# Altium schematic sheet DSP-1.SchDoc
size A4
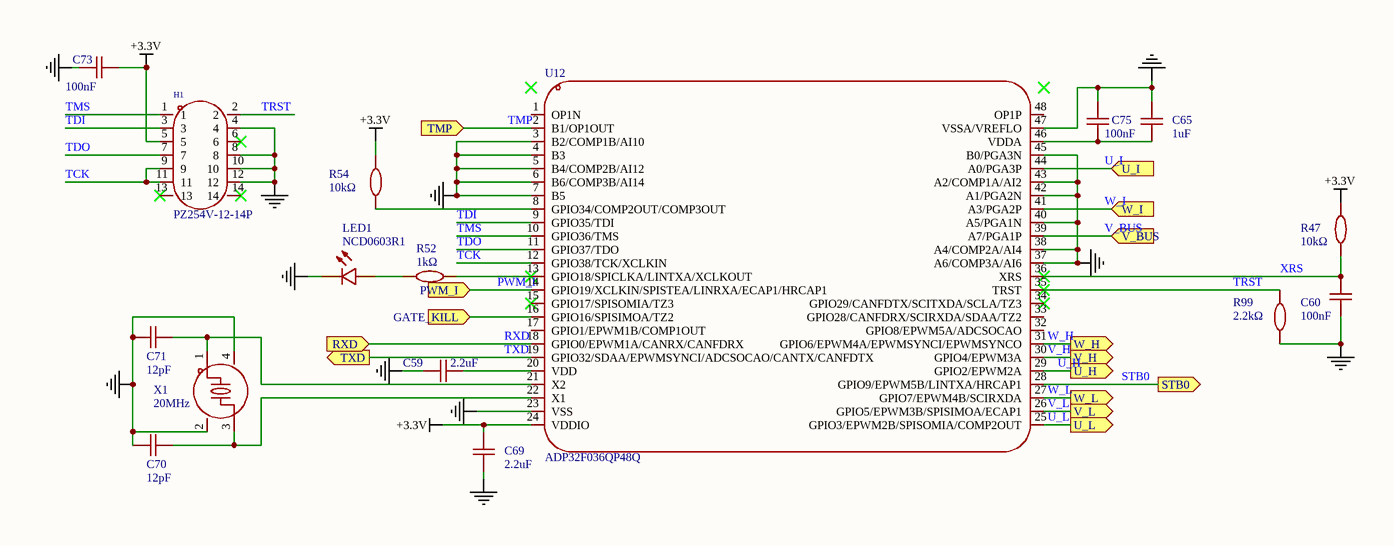
[diagram p0: DSP-1.SchDoc]

## Parts
C59  2.2uF  [C0603]
C60  100nF  [C0603]
C65  1uF  [C0603]
C69  2.2uF  [C0603]
C70  12pF  [C0603]
C71  12pF  [C0603]
C73  100nF  [C0603]
C75  100nF  [C0603]
H1  PZ254V-12-14P  [HDR-TH_14P-P2.54-V-M-R2-C7-S2.54]
LED1  NCD0603R1  [LED0603-RD_RED]
R47  10kΩ  [R0603]
R52  1kΩ  [R0603]
R54  10kΩ  [R0603]
R99  2.2kΩ  [R0603]
U12  ADP32F036QP48Q  [LQFP-48_L7.0-W7.0-P0.50-LS9.0-BL_1]
X1  20MHz  [CRYSTAL-SMD_4P-L3.2-W2.5-BL]

## Ports
GATE_KILL (in), PWM_I (in), RXD (in), STB0 (out), TMP (in), TXD (out), U_H (out), U_I (in), U_L (out), V_BUS (in), V_H (out), V_L (out), W_H (out), W_I (in), W_L (out)

## Nets
+3.3V: C69.1 C73.1 H1.5 R47.2 R54.2 U12.24(VDDIO)
GND: C59.1 C60.1 C65.1 C69.2 C70.2 C71.2 C73.2 C75.1 H1.4 H1.8 H1.10 H1.12 LED1.1(K) R99.1 U12.3(B2/COMP1B/AI10) U12.4(B3) U12.5(B4/COMP2B/AI12) U12.6(B6/COMP3B/AI14) U12.7(B5) U12.23(VSS) U12.37(A6/COMP3A/AI6) U12.38(A4/COMP2A/AI4) U12.40(A5/PGA1N) U12.42(A1/PGA2N) U12.43(A2/COMP1A/AI2) U12.45(B0/PGA3N) U12.47(VSSA/VREFLO) X1.2(GND) X1.4(GND)
GATE_KILL: U12.16(GPIO16/SPISIMOA/TZ2) ; port GATE_KILL
PWM_I: U12.14(GPIO19/XCLKIN/SPISTEA/LINRXA/ECAP1/HRCAP1) ; port PWM_I
RXD: U12.18(GPIO0/EPWM1A/CANRX/CANFDRX) ; port RXD
STB0: U12.28(GPIO9/EPWM5B/LINTXA/HRCAP1) ; port STB0
TCK: H1.9 H1.11 U12.12(GPIO38/TCK/XCLKIN)
TDI: H1.3 U12.9(GPIO35/TDI)
TDO: H1.7 U12.11(GPIO37/TDO)
TMP: U12.2(B1/OP1OUT) ; port TMP
TMS: H1.1 U12.10(GPIO36/TMS)
TRST: H1.2 R99.2 U12.35(TRST)
TXD: U12.19(GPIO32/SDAA/EPWMSYNCI/ADCSOCAO/CANTX/CANFDTX) ; port TXD
U_H: U12.29(GPIO2/EPWM2A) ; port U_H
U_I: U12.44(A0/PGA3P) ; port U_I
U_L: U12.25(GPIO3/EPWM2B/SPISOMIA/COMP2OUT) ; port U_L
V_BUS: U12.39(A7/PGA1P) ; port V_BUS
V_H: U12.30(GPIO4/EPWM3A) ; port V_H
V_L: U12.26(GPIO5/EPWM3B/SPISIMOA/ECAP1) ; port V_L
W_H: U12.31(GPIO6/EPWM4A/EPWMSYNCI/EPWMSYNCO) ; port W_H
W_I: U12.41(A3/PGA2P) ; port W_I
W_L: U12.27(GPIO7/EPWM4B/SCIRXDA) ; port W_L
XRS: C60.2 R47.1 U12.36(XRS)
NetC59_2: C59.2 U12.20(VDD)
NetC65_2: C65.2 C75.2 U12.46(VDDA)
NetC70_1: C70.1 U12.22(X1) X1.3
NetC71_1: C71.1 U12.21(X2) X1.1
NetLED1_2: LED1.2(A) R52.2
NetR52_1: R52.1 U12.13(GPIO18/SPICLKA/LINTXA/XCLKOUT)
NetR54_1: R54.1 U12.8(GPIO34/COMP2OUT/COMP3OUT)

Not connected (* = marked no-connect by the designer): H1 6* 13* 14*; U12 1(OP1N) 15(GPIO17/SPISOMIA/TZ3)* 17(GPIO1/EPWM1B/COMP1OUT) 32(GPIO8/EPWM5A/ADCSOCAO) 33(GPIO28/CANFDRX/SCIRXDA/SDAA/TZ2) 34(GPIO29/CANFDTX/SCITXDA/SCLA/TZ3)* 48(OP1P)

## Library data of the parts
C59 C69 = 0603B225K250NT: 容值:2.2uF;精度:±10%;额定电压:25V;材质(温度系数):X7R;; Manufacturer: FH(风华); Add into BOM: yes; Tolerance: ±10%; Voltage Rated: 25V; Temperature Coefficient: X7R; Symbol: 0603B225K250NT; Device: 0603B225K250NT; LCSC Part Name: 2.2uF ±10% 25V; Supplier Part: C99228; Manufacturer Part: 0603B225K250NT; Supplier Footprint: 0603; JLCPCB Part Class: 扩展库; Datasheet: https://atta.szlcsc.com/upload/public/pdf/source/20200305/C486355_26A10D38EF8C2A5C37091D0039909270.pdf; Supplier: LCSC; Convert to PCB: yes; Value: 2.2uF; Comment_1: 2.2uF
C60 C73 C75 = 0603B104K500NT: 容值:100nF;精度:±10%;额定电压:50V;材质(温度系数):X7R;; Manufacturer: FH(风华); Add into BOM: yes; Tolerance: ±10%; Voltage Rated: 50V; Temperature Coefficient: X7R; Symbol: 0603B104K500NT; Device: 0603B104K500NT; Supplier: LCSC; Manufacturer Part: 0603B104K500NT; Value: 100nF; Supplier Part: C30926; JLCPCB Part Class: 扩展库; LCSC Part Name: 100nF ±10% 50V; Supplier Footprint: 0603; Datasheet: https://atta.szlcsc.com/upload/public/pdf/source/20200305/C486355_26A10D38EF8C2A5C37091D0039909270.pdf; Convert to PCB: yes; Comment_1: 100nF
C65 = 0603B105K250NT: 容值:1uF;精度:±10%;额定电压:25V;材质(温度系数):X7R;; Manufacturer: FH(风华); Add into BOM: yes; Tolerance: ±10%; Voltage Rated: 25V; Temperature Coefficient: X7R; Symbol: 0603B105K250NT; Device: 0603B105K250NT; LCSC Part Name: 1uF ±10% 25V; Supplier Part: C59302; Manufacturer Part: 0603B105K250NT; Supplier Footprint: 0603; JLCPCB Part Class: 扩展库; Datasheet: https://atta.szlcsc.com/upload/public/pdf/source/20200305/C486355_26A10D38EF8C2A5C37091D0039909270.pdf; Supplier: LCSC; Convert to PCB: yes; Value: 1uF; Comment_1: 1uF
C70 C71 = CC0603JRNPO9BN120: 容值:12pF;精度:±5%;额定电压:50V;材质(温度系数):NP0;; Manufacturer: YAGEO(国巨); Add into BOM: yes; Tolerance: ±5%; Voltage Rated: 50V; Temperature Coefficient: NP0; Symbol: CC0603JRNPO9BN120; Device: CC0603JRNPO9BN120; Supplier: LCSC; Manufacturer Part: CC0603JRNPO9BN120; Value: 12pF; Supplier Part: C107034; JLCPCB Part Class: 扩展库; LCSC Part Name: 12pF ±5% 50V; Supplier Footprint: 0603; Datasheet: https://atta.szlcsc.com/upload/public/pdf/source/20170914/C128857_1505359892143968080.pdf; Convert to PCB: yes; Comment_1: 12pF
H1 = PZ254V-12-14P: 排数:双排;总PIN位数:14;间距:2.54mm;插针结构:2x7P;行距:2.54mm;安装类型:直插;圆针/方针:方针;额定电流:-;额定电压:-;配合针长度:6mm;塑高:2.5mm;端接针长度:3mm;触头材质:黄铜;触头镀层:-;工作温度范围:-40℃~+105℃;颜色:黑色;; Manufacturer: XFCN(兴飞); Add into BOM: yes; Pitch: 2.54mm; Pin Structure: 2x7P; Circluar Pins/Square Pins: 方针; Symbol: PZ254V-12-14P; Device: PZ254V-12-14P; Supplier: LCSC; Supplier Part: C492424; Manufacturer Part: PZ254V-12-14P; JLCPCB Part Class: Extended Part; LCSC Part Name: 2.54mm 2x7P 直插 方针; Supplier Footprint: 直插,P=2.54mm; Convert to PCB: yes; Number of Rows: 双排; Number of Pins: 14; Row Spacing: 2.54mm; Mounting Type: 直插; Current Rating (Max): -; Voltage Rating (Max): -; Length of Mating Pin: 6mm; Insulation Height: 2.5mm; Length of End Connection Pin: 3mm; Contact Material: 黄铜; Contact Plating: -; Operating Temperature Range: -40℃~+105℃; Color: 黑色; Comment_1: PZ254V-12-14P
LED1 = NCD0603R1_C84263: 灯头类型:-;发光颜色:红色;正向电压(VF):1.6V~2.6V;功率:65mW;正向电流:20mA;主波长:615nm~630nm;二极管配置:独立二极管;透镜颜色:无色透明透镜;色温:-;发光强度:80mcd~220mcd;发光角度:130°;载带方式:-;工作温度:-30℃~+85℃;; Manufacturer: 国星光电; Symbol: FC-DA1608HRK-620D; Add into BOM: yes; Emitted Color: 红色; Power Dissipation: 65mW; Forward Current: 20mA; Diode Configuration: 独立二极管; Lens Color: 无色透明透镜; Viewing Angle: 130°; Device: NCD0603R1_C84263; Supplier: LCSC; Manufacturer Part: NCD0603R1; Supplier Part: C84263; JLCPCB Part Class: 扩展库; LCSC Part Name: NCD0603R1; Supplier Footprint: 0603; Datasheet: https://atta.szlcsc.com/upload/public/pdf/source/20200820/C84263_DABC6A75E58F576973B407FDBA283D60.pdf; Convert to PCB: yes; Lamp Holder Type: -; Forward Voltage (VF): 1.6V~2.6V; Dominant Wavelength: 615nm~630nm; Peak Wavelength: -; Color Temperature: -; Luminous Intensity: 80mcd~220mcd; Mounting Sytle: -; Operating Temperature: -30℃~+85℃; Comment_1: NCD0603R1
R47 R54 = 0603WAF1002T5E: 电阻类型:厚膜电阻;阻值:10kΩ;精度:±1%;功率:100mW;最大工作电压:75V;温度系数:±100ppm/℃;; Manufacturer: UNI-ROYAL(厚声); Add into BOM: yes; Tolerance: ±1%; Power(Watts): 100mW; Overload Voltage (Max): 75V; Symbol: 0603WAF1002T5E; Device: 0603WAF1002T5E; Supplier: LCSC; Manufacturer Part: 0603WAF1002T5E; Supplier Part: C25804; Value: 10kΩ; JLCPCB Part Class: 基础库; LCSC Part Name: 厚膜电阻 10kΩ ±1% 100mW; Supplier Footprint: 0603; Datasheet: https://atta.szlcsc.com/upload/public/pdf/source/20200306/C422600_1E6D84923E4A46A82E41ADD87F860B5C.pdf; Convert to PCB: yes; Type: 厚膜电阻; Temperature Coefficient: ±100ppm/℃; Operating Temperature Range: -55℃~+155℃; Comment_1: 10kΩ
R52 = RC0603FR-071KL: 电阻类型:厚膜电阻;阻值:1kΩ;精度:±1%;功率:100mW;最大工作电压:75V;温度系数:±100ppm/℃;; Manufacturer: YAGEO(国巨); Add into BOM: yes; Tolerance: ±1%; Power(Watts): 100mW; Overload Voltage (Max): 75V; Symbol: RC0603FR-071KL; Device: RC0603FR-071KL; LCSC Part Name: 厚膜电阻 1kΩ ±1% 100mW; Supplier Part: C22548; Manufacturer Part: RC0603FR-071KL; Supplier Footprint: 0603; JLCPCB Part Class: 扩展库; Datasheet: https://atta.szlcsc.com/upload/public/pdf/source/20180316/70C0E2BDAE7FCC62C531A5A58D202EE1.pdf; Supplier: LCSC; Convert to PCB: yes; Type: 厚膜电阻; Value: 1kΩ; Temperature Coefficient: ±100ppm/℃; Operating Temperature Range: -55℃~+155℃; Comment_1: 1kΩ
R99 = 0603WAF2201T5E: 电阻类型:厚膜电阻;阻值:2.2kΩ;精度:±1%;功率:100mW;; Manufacturer: UNI-ROYAL(厚声); Add into BOM: yes; Tolerance: ±1%; Power(Watts): 100mW; Temperature Coefficient: ±100ppm/℃; Overload Voltage (Max): 75V; Symbol: 0603WAF2201T5E; Device: 0603WAF2201T5E; LCSC Part Name: 2.2kΩ ±1% 100mW; Supplier Part: C4190; Manufacturer Part: 0603WAF2201T5E; Supplier Footprint: 0603; JLCPCB Part Class: Basic Part; Datasheet: https://atta.szlcsc.com/upload/public/pdf/source/20200306/C422600_1E6D84923E4A46A82E41ADD87F860B5C.pdf; Supplier: LCSC; Convert to PCB: yes; Type: 厚膜电阻; Value: 2.2kΩ; Operating Temperature Range: -55℃~+155℃; Comment_1: 2.2kΩ
U12 = ADP32F036QP48S: Add into BOM: yes; Symbol: ADP32F036QP48S; Device: ADP32F036QP48S; Convert to PCB: yes; Comment_1: ADP32F036QP48Q
X1 = XXDBBCNANF-20.000000MHZ: 晶振类型:贴片晶振;频率:20MHz;常温频差:±10ppm;外接负载电容:12pF;频率稳定度(全温):±10ppm;; Manufacturer: TAITIEN(泰艺电子); Add into BOM: yes; Crystal Type: 贴片晶振; Normal temperature Frequency Tolerance: ±10ppm; External load capacitor: 12pF; Symbol: XXDBBCNANF-20.000000MHZ; Device: XXDBBCNANF-20.000000MHZ; LCSC Part Name: 20MHz ±10ppm 12pF; Supplier Part: C521592; Manufacturer Part: XXDBBCNANF-20.000000MHZ; Supplier Footprint: SMD3225-4P; JLCPCB Part Class: 扩展库; Datasheet: https://atta.szlcsc.com/upload/public/pdf/source/20171013/C124322_15078985210081032928.pdf; Supplier: LCSC; Convert to PCB: yes; Value: 20MHz; Frequency Stability(Full temperature range): ±10ppm; Operating Temperature: -20℃~+70℃; Comment_1: 20MHz